# Altium project Main_Board.PrjPcb (part 16 of 44)
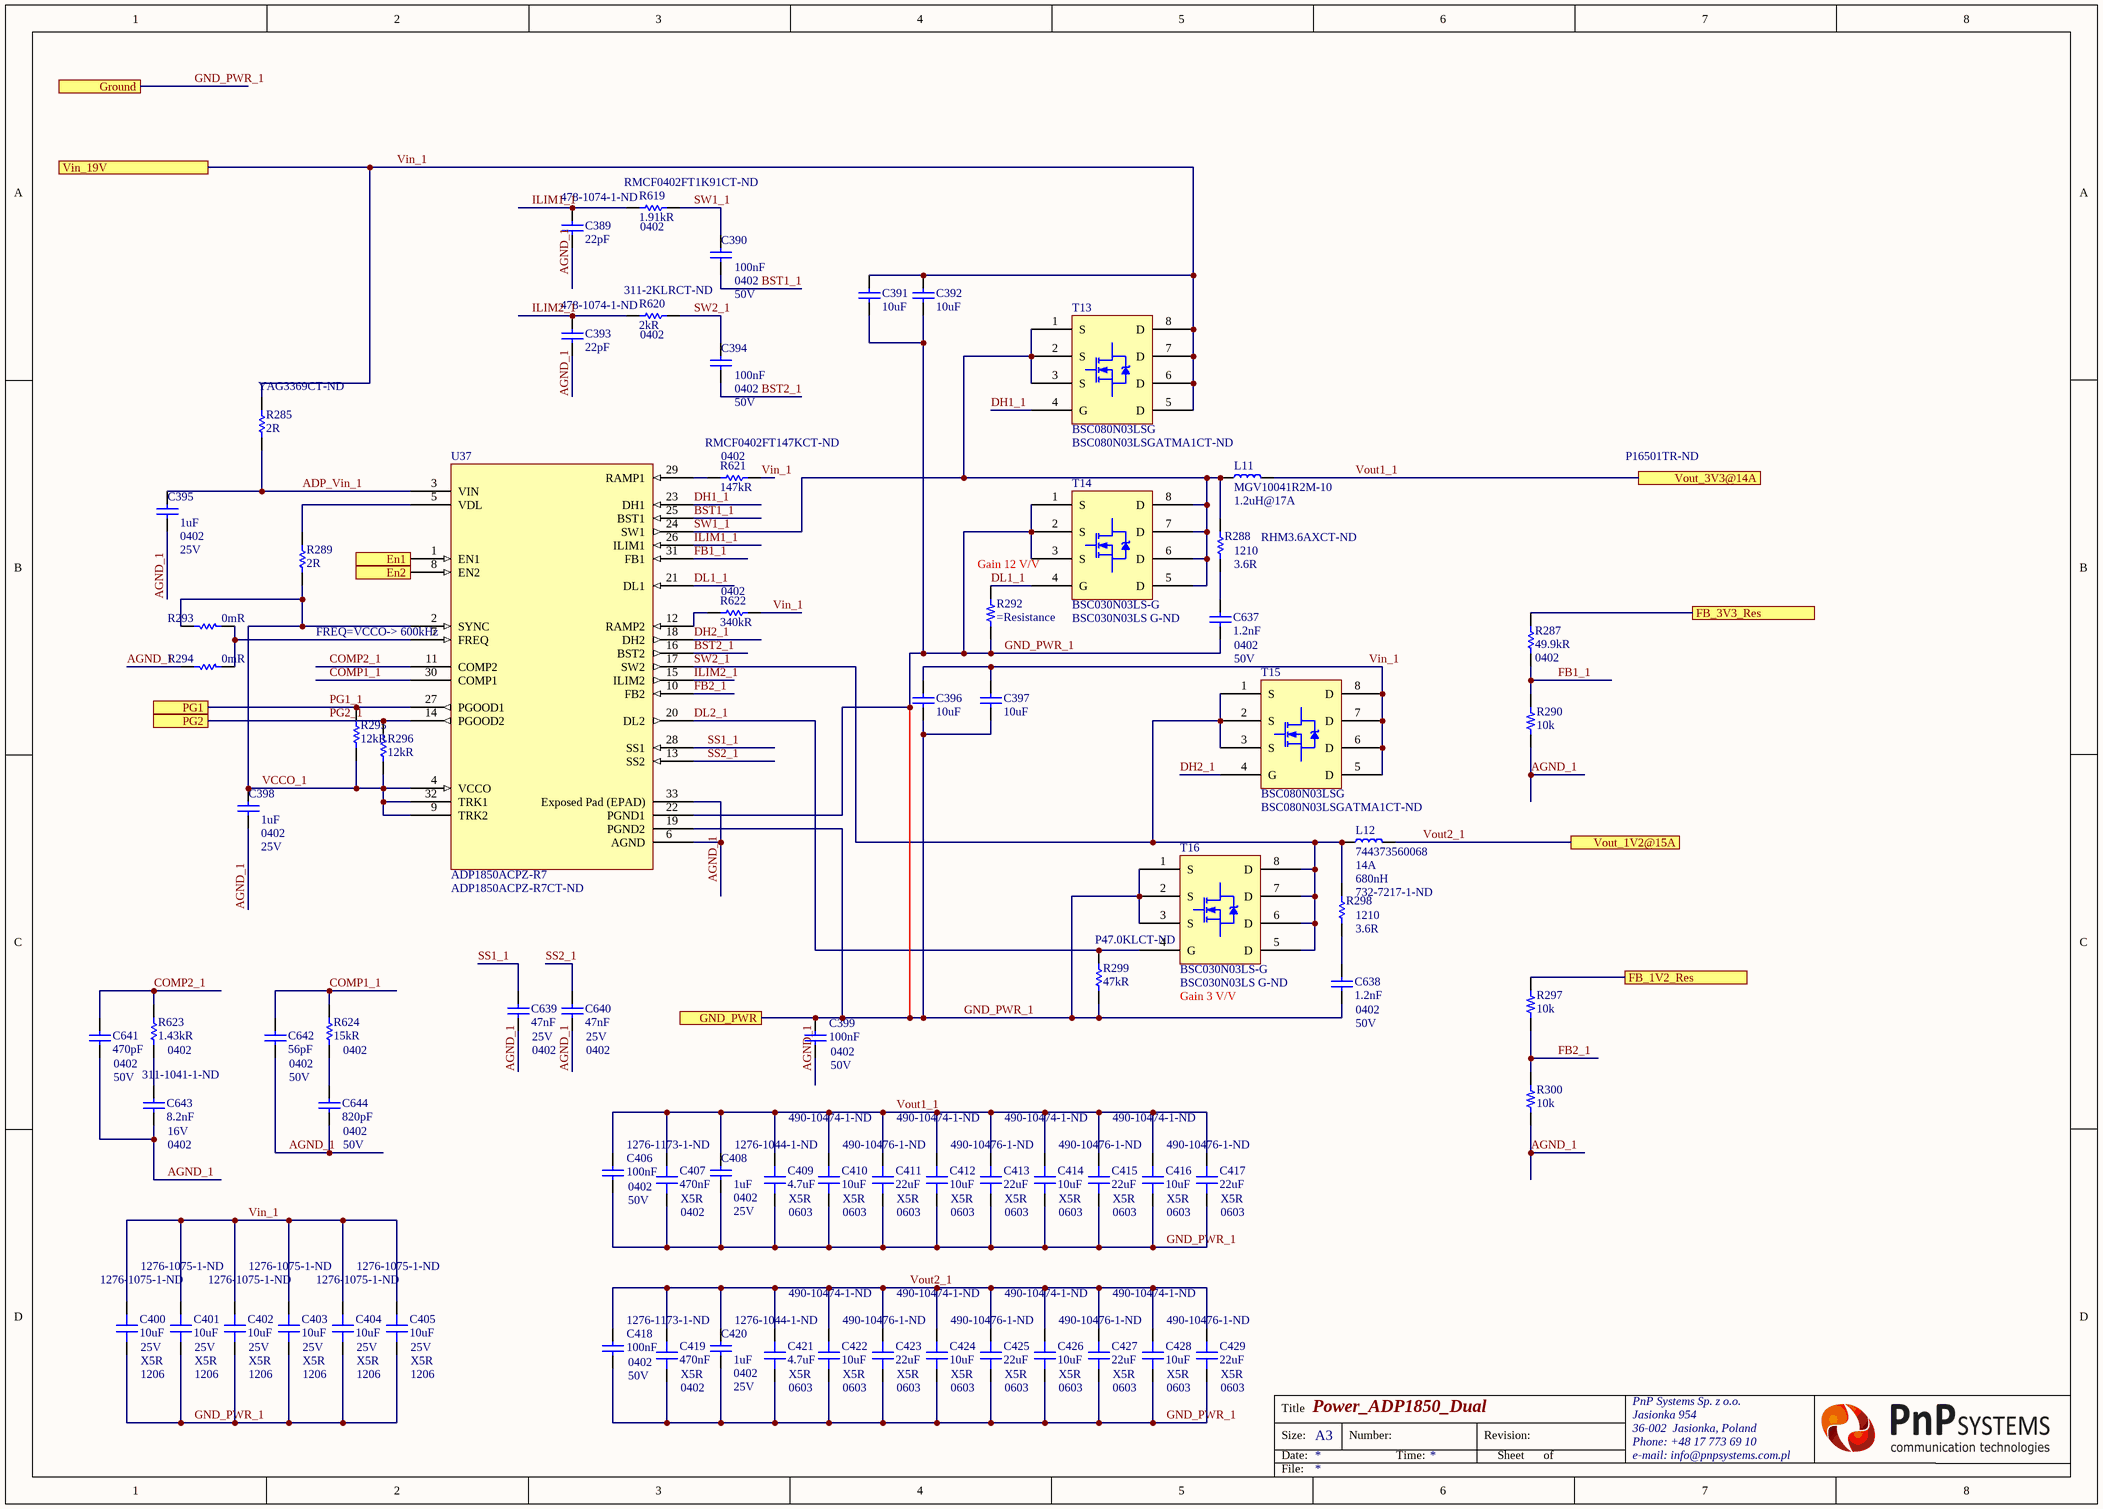
[diagram p127: Power_ADP1850_Dual.SchDoc]

## Sheet Power_ADP1850_Dual.SchDoc: Power_ADP1850_Dual (continued)

### Parts
C389  22pF  Supplier Part Number 1: 478-1074-1-ND  [CAP 0402/1005 KK]
C390  100nF  Case Code (Imperial): 0402  Voltage: 50V  [CAP 0402/1005 KK]
C391  10uF  [CAP 1206/3216]
C392  10uF  [CAP 1206/3216]
C393  22pF  Supplier Part Number 1: 478-1074-1-ND  [CAP 0402/1005 KK]
C394  100nF  Case Code (Imperial): 0402  Voltage: 50V  [CAP 0402/1005 KK]
C395  1uF  Case/Package: 0402  Voltage Rating: 25V  [CAP 0402/1005 KK]
C396  10uF  [CAP 1206/3216]
C397  10uF  [CAP 1206/3216]
C398  1uF  Case/Package: 0402  Voltage Rating: 25V  [CAP 0402/1005 KK]
C399  100nF  Case Code (Imperial): 0402  Voltage: 50V  [CAP 0402/1005 KK]
C400  10uF  Supplier Part Number 1: 1276-1075-1-ND  Case/Package: 1206  Dielectric: X5R  Voltage: 25V  [CAP 1206/3216 - 0.8MM]
C401  10uF  Supplier Part Number 1: 1276-1075-1-ND  Case/Package: 1206  Dielectric: X5R  Voltage: 25V  [CAP 1206/3216 - 0.8MM]
C402  10uF  Supplier Part Number 1: 1276-1075-1-ND  Case/Package: 1206  Dielectric: X5R  Voltage: 25V  [CAP 1206/3216 - 0.8MM]
C403  10uF  Supplier Part Number 1: 1276-1075-1-ND  Case/Package: 1206  Dielectric: X5R  Voltage: 25V  [CAP 1206/3216 - 0.8MM]
C404  10uF  Supplier Part Number 1: 1276-1075-1-ND  Case/Package: 1206  Dielectric: X5R  Voltage: 25V  [CAP 1206/3216 - 0.8MM]
C405  10uF  Supplier Part Number 1: 1276-1075-1-ND  Case/Package: 1206  Dielectric: X5R  Voltage: 25V  [CAP 1206/3216 - 0.8MM]
C406  100nF  Case Code (Imperial): 0402  Voltage: 50V  [CAP 0402/1005 KK]
C407  470nF  Supplier Part Number 1: 1276-1173-1-ND  Case/Package: 0402  Dielectric: X5R  [CAP 0402/1005 KK]
C408  1uF  Case/Package: 0402  Voltage Rating: 25V  [CAP 0402/1005 KK]
C409  4.7uF  Supplier Part Number 1: 1276-1044-1-ND  Case/Package: 0603  Dielectric: X5R  [CAP 0603/1608 RF]
C410  10uF  Supplier Part Number 1: 490-10474-1-ND  Case/Package: 0603  Dielectric: X5R  [CAP 0603/1608 RF]
C411  22uF  Supplier Part Number 1: 490-10476-1-ND  Case/Package: 0603  Dielectric: X5R  [CAP 0603/1608 RF]
C412  10uF  Supplier Part Number 1: 490-10474-1-ND  Case/Package: 0603  Dielectric: X5R  [CAP 0603/1608 RF]
C413  22uF  Supplier Part Number 1: 490-10476-1-ND  Case/Package: 0603  Dielectric: X5R  [CAP 0603/1608 RF]
C414  10uF  Supplier Part Number 1: 490-10474-1-ND  Case/Package: 0603  Dielectric: X5R  [CAP 0603/1608 RF]
C415  22uF  Supplier Part Number 1: 490-10476-1-ND  Case/Package: 0603  Dielectric: X5R  [CAP 0603/1608 RF]
C416  10uF  Supplier Part Number 1: 490-10474-1-ND  Case/Package: 0603  Dielectric: X5R  [CAP 0603/1608 RF]
C417  22uF  Supplier Part Number 1: 490-10476-1-ND  Case/Package: 0603  Dielectric: X5R  [CAP 0603/1608 RF]
C418  100nF  Case Code (Imperial): 0402  Voltage: 50V  [CAP 0402/1005 KK]
C419  470nF  Supplier Part Number 1: 1276-1173-1-ND  Case/Package: 0402  Dielectric: X5R  [CAP 0402/1005 KK]
C420  1uF  Case/Package: 0402  Voltage Rating: 25V  [CAP 0402/1005 KK]
C421  4.7uF  Supplier Part Number 1: 1276-1044-1-ND  Case/Package: 0603  Dielectric: X5R  [CAP 0603/1608 RF]
C422  10uF  Supplier Part Number 1: 490-10474-1-ND  Case/Package: 0603  Dielectric: X5R  [CAP 0603/1608 RF]
C423  22uF  Supplier Part Number 1: 490-10476-1-ND  Case/Package: 0603  Dielectric: X5R  [CAP 0603/1608 RF]
C424  10uF  Supplier Part Number 1: 490-10474-1-ND  Case/Package: 0603  Dielectric: X5R  [CAP 0603/1608 RF]
C425  22uF  Supplier Part Number 1: 490-10476-1-ND  Case/Package: 0603  Dielectric: X5R  [CAP 0603/1608 RF]
C426  10uF  Supplier Part Number 1: 490-10474-1-ND  Case/Package: 0603  Dielectric: X5R  [CAP 0603/1608 RF]
C427  22uF  Supplier Part Number 1: 490-10476-1-ND  Case/Package: 0603  Dielectric: X5R  [CAP 0603/1608 RF]
C428  10uF  Supplier Part Number 1: 490-10474-1-ND  Case/Package: 0603  Dielectric: X5R  [CAP 0603/1608 RF]
C429  22uF  Supplier Part Number 1: 490-10476-1-ND  Case/Package: 0603  Dielectric: X5R  [CAP 0603/1608 RF]
C637  1.2nF  Case/Package: 0402  Voltage Rating (DC): 50V  [CAP 0402/1005 KK]
C638  1.2nF  Case/Package: 0402  Voltage Rating (DC): 50V  [CAP 0402/1005 KK]
C639  47nF  Case Code (Imperial): 0402  Voltage Rating: 25V  [CAP 0402/1005 KK]
C640  47nF  Case Code (Imperial): 0402  Voltage Rating: 25V  [CAP 0402/1005 KK]
C641  470pF  Case/Package: 0402  Voltage: 50V  [CAP 0402/1005 KK]
C642  56pF  Case Code (Imperial): 0402  Voltage Rating: 50V  [CAP 0402/1005 KK]
C643  8.2nF  Supplier Part Number 1: 311-1041-1-ND  Case Code (Imperial): 0402  Voltage Rating: 16V  [CAP 0402/1005 KK]
C644  820pF  Case Code (Imperial): 0402  Voltage: 50V  [CAP 0402/1005 KK]
L11  MGV10041R2M-10  Inductance: 1.2uH@17A  [MGV1004 Series]
L12  744373560068  Current Rating: 14A  Inductance: 680nH  Supplier Part Number 1: 732-7217-1-ND  [744373560068]
R285  2R  Supplier Part Number 1: YAG3369CT-ND  [RES 0402/1005 RF KK]
R287  49.9kR  Case/Package: 0402  [RES 0402/1005 RF KK]
R288  value 3.6R  Supplier Part Number 1: RHM3.6AXCT-ND  Case/Package: 1210  [RES_1210]  (hidden comment: Resistor_1210)
R289  2R  [RES 0402/1005 RF KK]
R290  10k  [RES 0402/1005 RF KK]
R292  (no value)  [RES 0402/1005 RF KK]
R293  0mR  [RES 0402/1005 RF KK]
R294  0mR  [RES 0402/1005 RF KK]
R295  12kR  [RES 0402/1005 RF KK]
R296  12kR  [RES 0402/1005 RF KK]
R297  10k  [RES 0402/1005 RF KK]
R298  value 3.6R  Case/Package: 1210  [RES_1210]  (hidden comment: Resistor_1210)
R299  47kR  Supplier Part Number 1: P47.0KLCT-ND  [RES 0402/1005 RF KK]
R300  10k  [RES 0402/1005 RF KK]
R619  1.91kR  Supplier Part Number 1: RMCF0402FT1K91CT-ND  Case Code (Imperial): 0402  [RES 0402/1005 RF KK]
R620  2kR  Supplier Part Number 1: 311-2KLRCT-ND  Case Code (Imperial): 0402  [RES 0402/1005 RF KK]
R621  147kR  Case Code (Imperial): 0402  Supplier Part Number 2: RMCF0402FT147KCT-ND  [RES 0402/1005 RF KK]
R622  340kR  Case Code (Imperial): 0402  [RES 0402/1005 RF KK]
R623  1.43kR  Case Code (Imperial): 0402  [RES 0402/1005 RF KK]
R624  15kR  Case Code (Imperial): 0402  [RES 0402/1005 RF KK]
T13  BSC080N03LSG  Supplier Part Number 1: BSC080N03LSGATMA1CT-ND  [BSC080N03LS]
T14  BSC030N03LS-G  Supplier Part Number 1: BSC030N03LS G-ND  [BSC030N03LS]
T15  BSC080N03LSG  Supplier Part Number 1: BSC080N03LSGATMA1CT-ND  [BSC080N03LS]
T16  BSC030N03LS-G  Supplier Part Number 1: BSC030N03LS G-ND  [BSC030N03LS]
U37  ADP1850ACPZ-R7  Supplier Part Number 1: ADP1850ACPZ-R7CT-ND  [ADP1850]

### Ports
En1, En2, FB_1V2_Res, FB_3V3_Res, GND_PWR, Ground, PG1, PG2, Vin_19V, Vout_1V2@15A, Vout_3V3@14A

### Nets
GND_PWR_1: C391.2 C392.1 C396.1 C397.2 C399.2 C400.1 C401.1 C402.1 C403.1 C404.1 C405.1 C406.1 C407.1 C408.2 C409.1 C410.1 C411.1 C412.1 C413.1 C414.1 C415.1 C416.1 C417.1 C418.1 C419.1 C420.2 C421.1 C422.1 C423.1 C424.1 C425.1 C426.1 C427.1 C428.1 C429.1 C637.1 C638.1 R292.1 R299.1 T14.1(S) T14.2(S) T14.3(S) T16.1(S) T16.2(S) T16.3(S) U37.19(PGND2) U37.22(PGND1) ; port Ground, port GND_PWR  [project net B503_Ground]
3V3_RAIL: R287.2 ; port FB_3V3_Res
ADP_Vin_1: C395.1 R285.2 U37.3(VIN)
AGND_1: C389.1 C393.1 C395.2 C398.2 C399.1 C639.1 C640.1 C641.1 C642.1 C643.1 C644.1 R290.2 R294.2 R300.2 U37.6(AGND) U37.33(Exposed_Pad_(EPAD))
BST1_1: C390.1 U37.25(BST1)
BST2_1: C394.1 U37.16(BST2)
COMP1_1: C642.2 R624.2 U37.30(COMP1)
COMP2_1: C641.2 R623.2 U37.11(COMP2)
DH1_1: T13.4(G) U37.23(DH1)
DH2_1: T15.4(G) U37.18(DH2)
DL1_1: R292.2 T14.4(G) U37.21(DL1)
DL2_1: R299.2 T16.4(G) U37.20(DL2)
EN_3V3V_REG0: U37.1(EN1) ; port En1
FB1_1: R287.1 R290.1 U37.31(FB1)
FB2_1: R297.2 R300.1 U37.10(FB2)
ILIM1_1: C389.2 R619.1 U37.26(ILIM1)
ILIM2_1: C393.2 R620.1 U37.15(ILIM2)
PG1_1: R295.2 U37.27(PGOOD1) ; port PG1
PG2_1: R296.2 U37.14(PGOOD2) ; port PG2  [project net En_0V85@2A]
PG2_TPS7A8801_0V9: U37.8(EN2) ; port En2
RAM_Vcc1V2: R297.1 ; port FB_1V2_Res
SS1_1: C639.2 U37.28(SS1)
SS2_1: C640.2 U37.13(SS2)
SW1_1: C390.2 L11.1 R288.2 R619.2 T13.1(S) T13.2(S) T13.3(S) T14.5(D) T14.6(D) T14.7(D) T14.8(D) U37.24(SW1)
SW2_1: C394.2 L12.1 R298.2 R620.2 T15.1(S) T15.2(S) T15.3(S) T16.5(D) T16.6(D) T16.7(D) T16.8(D) U37.17(SW2)
VCCO_1: C398.1 R289.2 R293.2 R295.1 R296.1 U37.2(SYNC) U37.4(VCCO) U37.9(TRK2) U37.32(TRK1)
Vin_1: C391.1 C392.2 C396.2 C397.1 C400.2 C401.2 C402.2 C403.2 C404.2 C405.2 R285.1 R621.2 R622.2 T13.5(D) T13.6(D) T13.7(D) T13.8(D) T15.5(D) T15.6(D) T15.7(D) T15.8(D) ; port Vin_19V  [project net PWR_OUT_20V]
Vout1_1: C406.2 C407.2 C408.1 C409.2 C410.2 C411.2 C412.2 C413.2 C414.2 C415.2 C416.2 C417.2 L11.2 ; port Vout_3V3@14A
Vout2_1: C418.2 C419.2 C420.1 C421.2 C422.2 C423.2 C424.2 C425.2 C426.2 C427.2 C428.2 C429.2 L12.2 ; port Vout_1V2@15A
NetC637_2: C637.2 R288.1
NetC638_2: C638.2 R298.1
NetC643_2: C643.2 R623.1
NetC644_2: C644.2 R624.1
NetR289_1: R289.1 U37.5(VDL)
NetR293_1: R293.1 R294.1 U37.7(FREQ)
NetR621_1: R621.1 U37.29(RAMP1)
NetR622_1: R622.1 U37.12(RAMP2)

### Notes on the sheet
- P16501TR-ND
- Gain 12 V/V
- (near U37) FREQ=VCCO-> 600kHz
- (near T16) Gain 3 V/V
- Title
- Size:
- Date:
- A3
- Number:
- Time:
- Revision:
- Sheet
- of
- File: